# EasyEDA Pro project ProPrj_CSDR_2026-11-13.epro, schematic Schematic2

## Sheets
1 P1: Board Name: Board2; Create Date: 2026-11-10; Page Name: P1; Project Name: CSDR; Schematic Name: Schematic2; Update Date: 2026-11-10; Company: EasyEDA.com; Page Size: A4; Version: V1.0
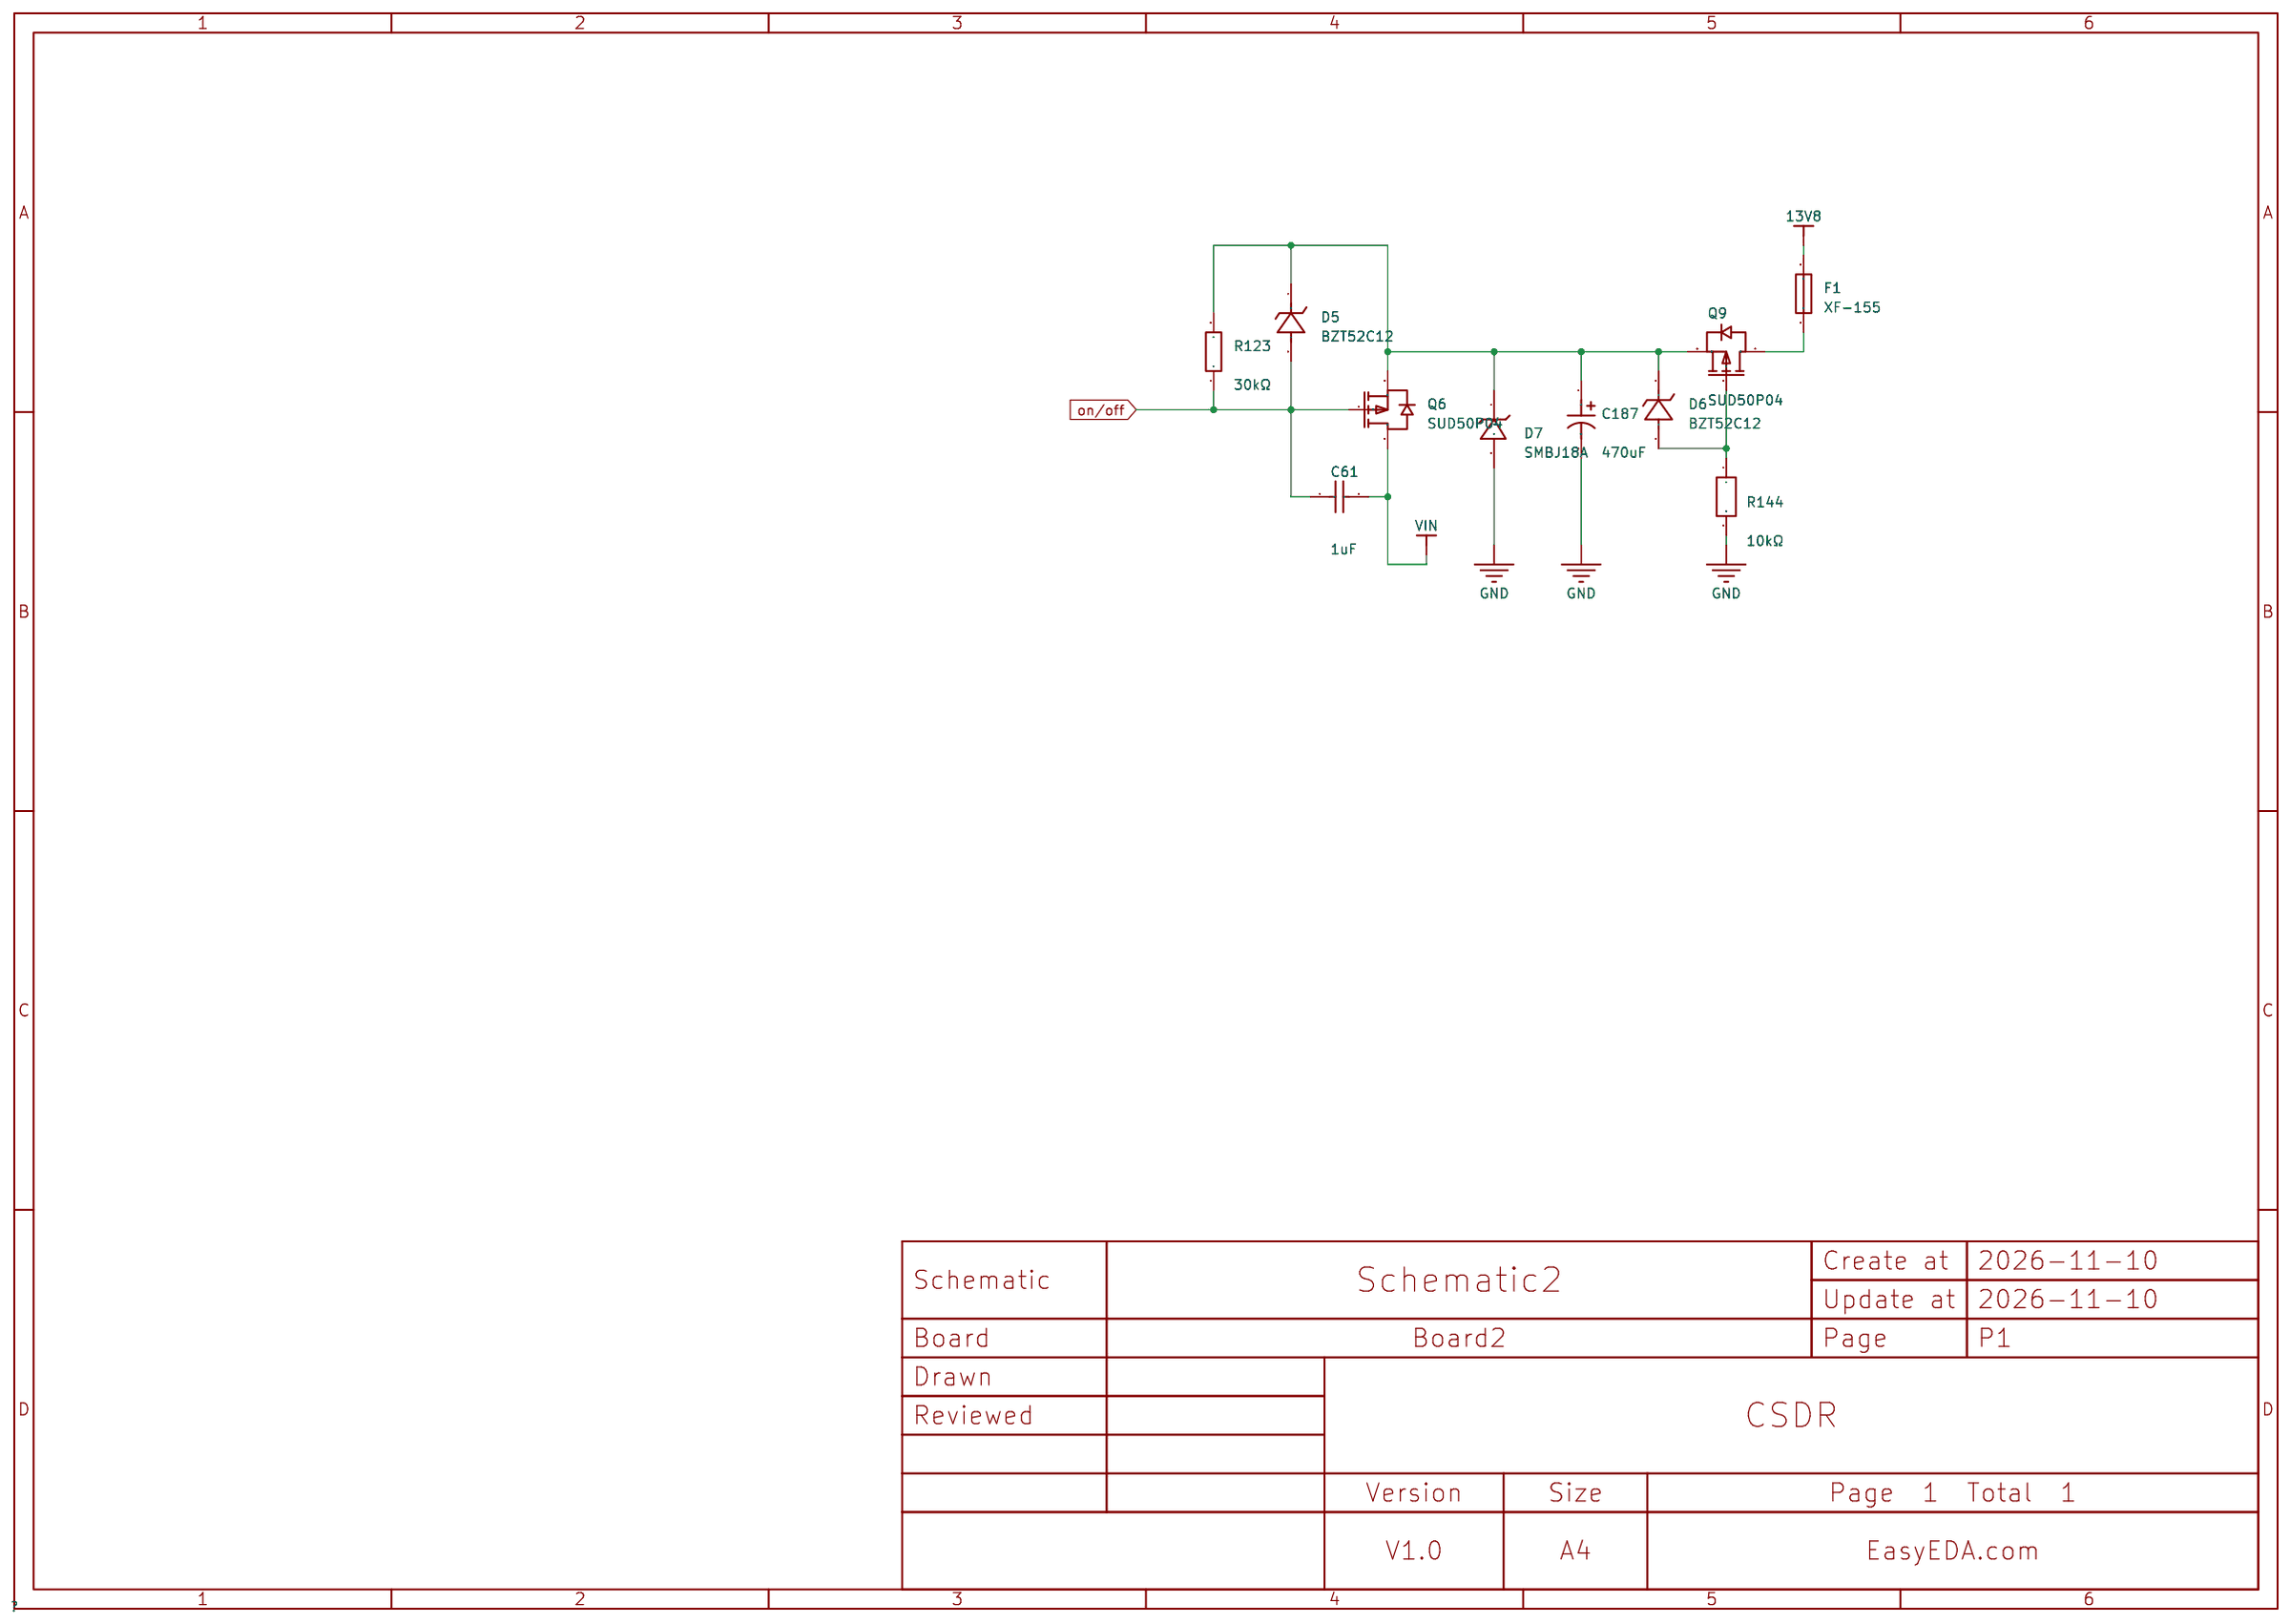
[diagram p0: P1]
2 PA_CONTROL: Board Name: Board1; Create Date: 2026-10-03; Schematic Name: Schematic1; Update Date: 2026-10-03
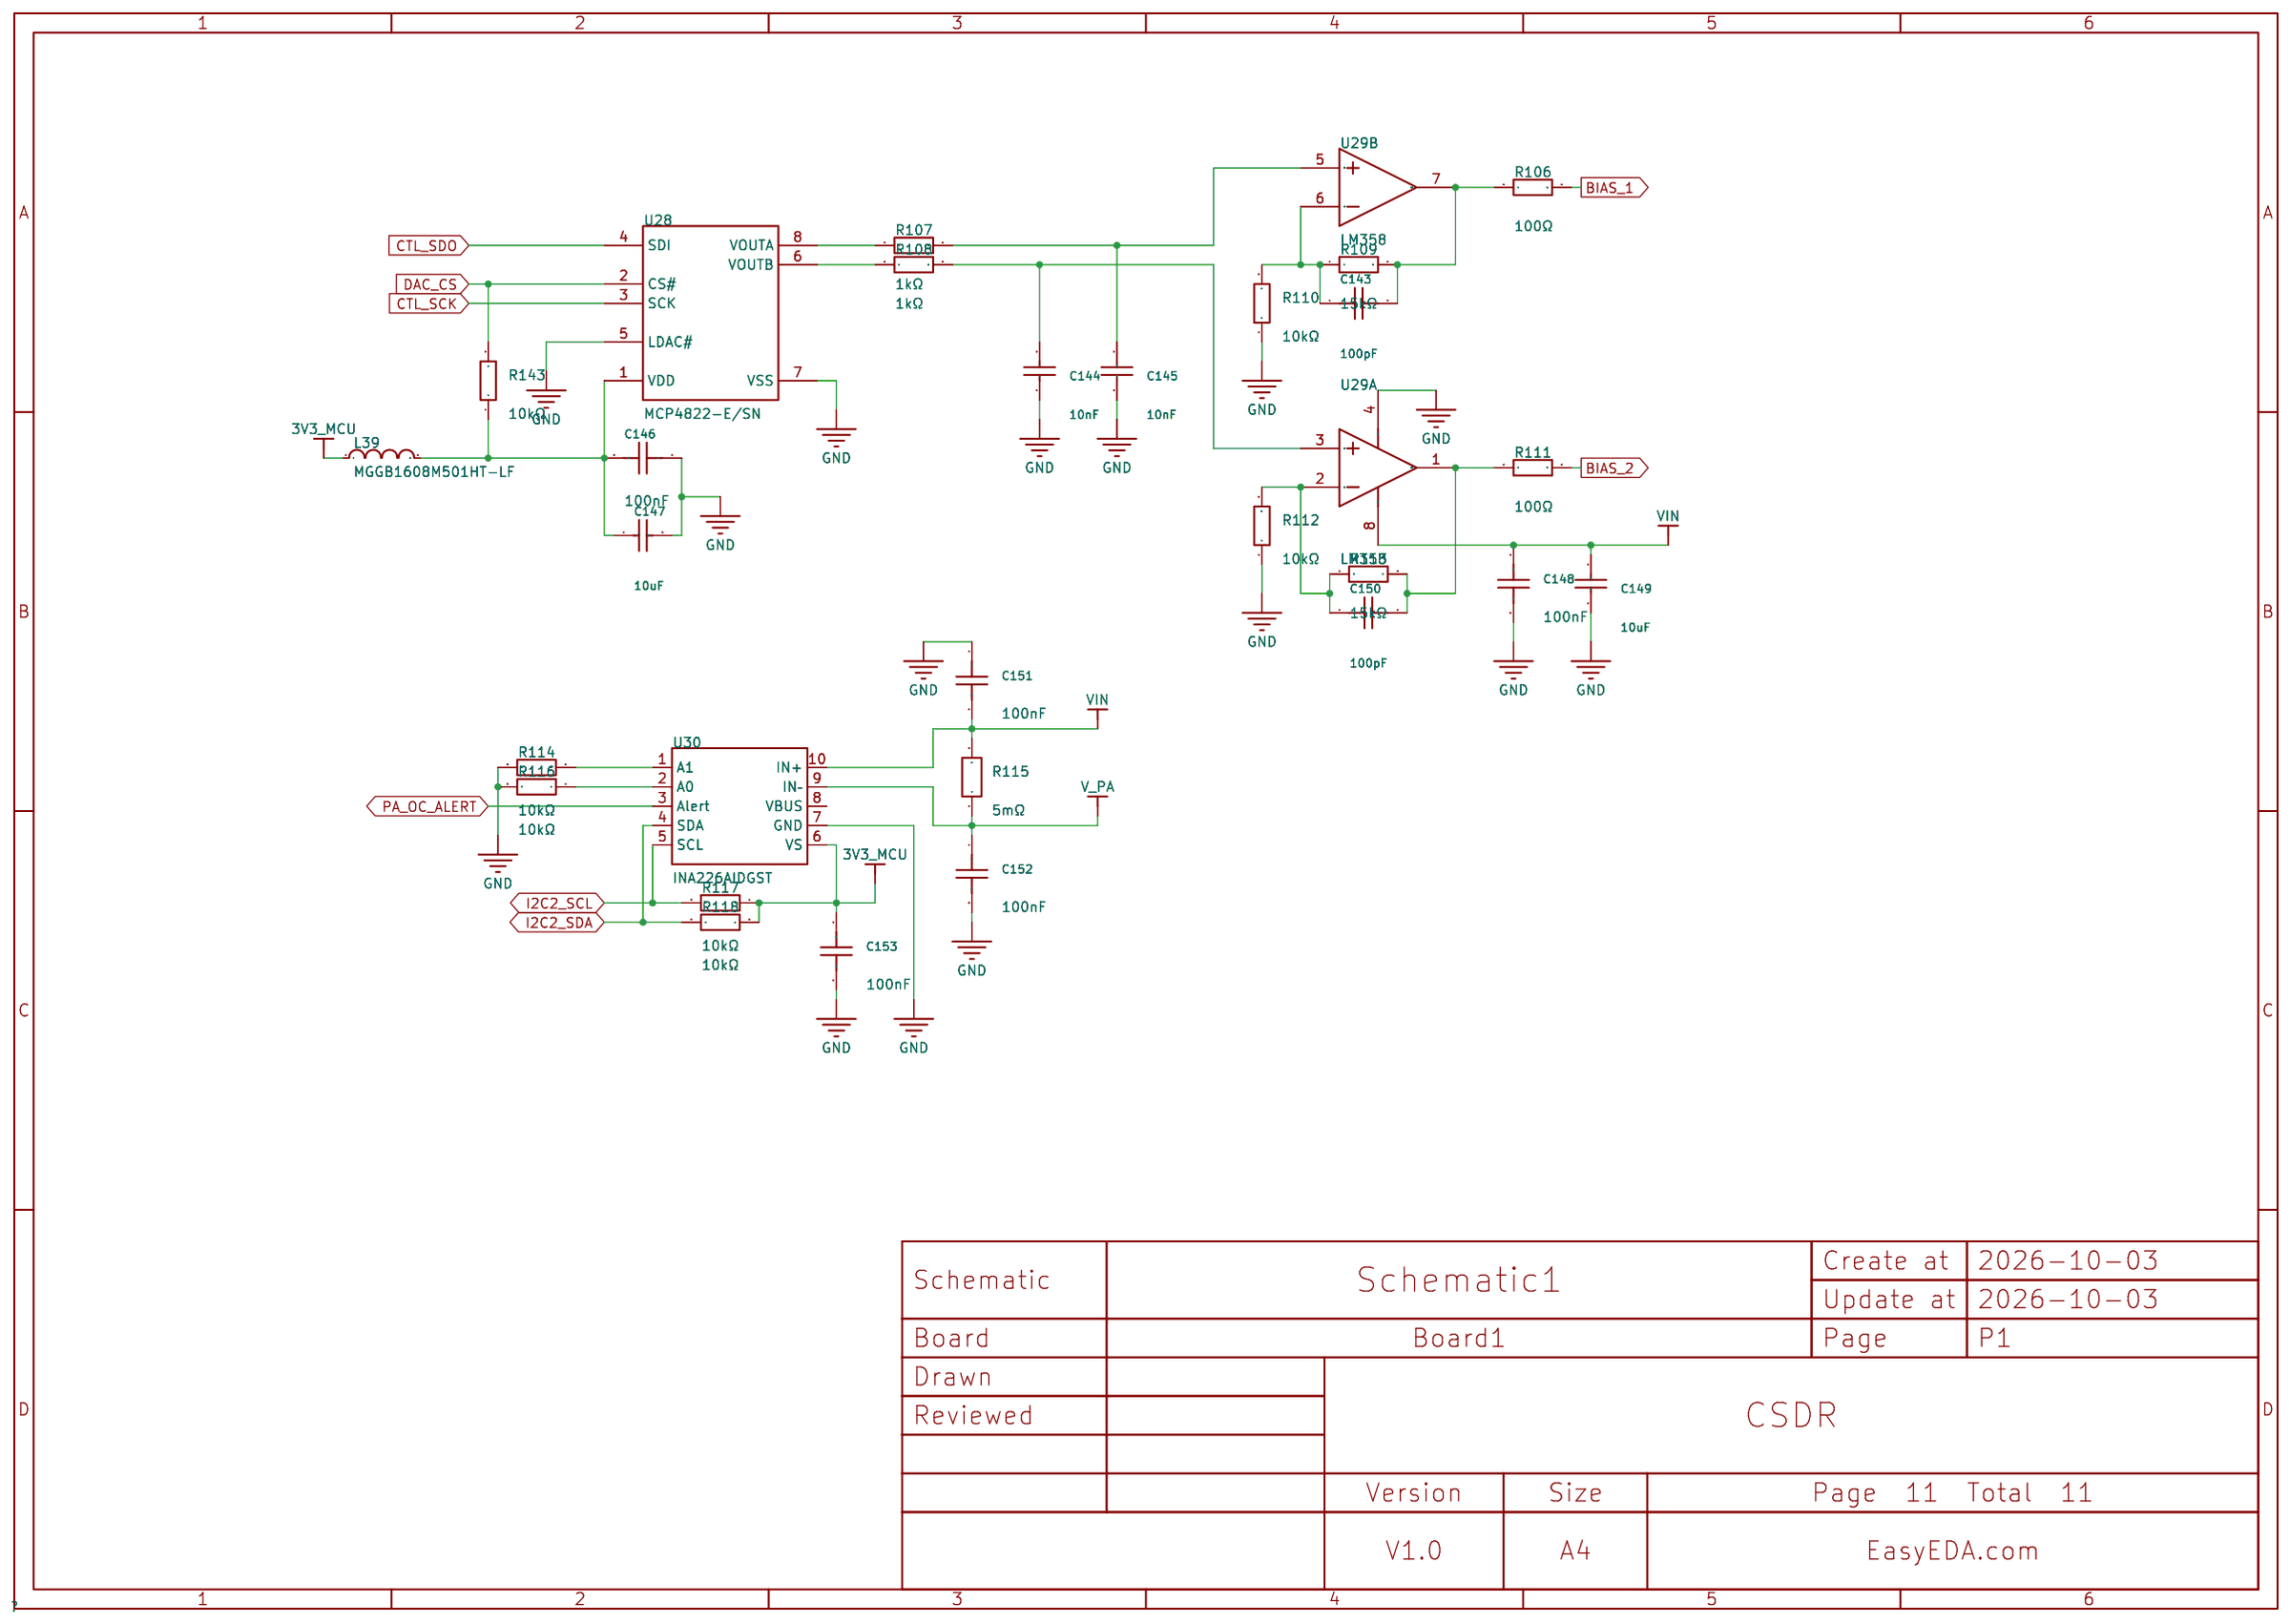
[diagram p1: PA_CONTROL]

## Parts
sheet P1
C61  1uF  [C0603]
C187  470uF  [CAP-SMD_BD6.3-L6.6-W6.6-LS7.3-FD-H7.7]
D5  BZT52C12  [SOD-123_L2.7-W1.7-LS3.8-RD]
D6  BZT52C12  [SOD-123_L2.7-W1.7-LS3.8-RD]
D7  SMBJ18A  [SMB_L4.6-W3.6-LS5.3-RD]
F1  XF-155  [FUSE-SMD_L10.5-W5.1]
Q6  SUD50P04  [TO-252-3_L6.6-W6.1-P4.57-LS9.9-BR-CW]
Q9  SUD50P04  [TO-252-3_L6.6-W6.1-P4.57-LS9.9-BR-CW]
R123  30kΩ  [R0603]
R144  10kΩ  [R0603]
sheet PA_CONTROL
C143  100pF  [C0603]
C144  10nF  [C0603]
C145  10nF  [C0603]
C146  100nF  [C0603]
C147  10uF  [C0603]
C148  100nF  [C0603]
C149  10uF  [C0603]
C150  100pF  [C0603]
C151  100nF  [C0603]
C152  100nF  [C0603]
C153  100nF  [C0603]
L39  MGGB1608M501HT-LF  [L0603]
R106  100Ω  [R0603]
R107  1kΩ  [R0603]
R108  1kΩ  [R0603]
R109  15kΩ  [R0603]
R110  10kΩ  [R0603]
R111  100Ω  [R0603]
R112  10kΩ  [R0603]
R113  15kΩ  [R0603]
R114  10kΩ  [R0603]
R115  5mΩ  [R2512]
R116  10kΩ  [R0603]
R117  10kΩ  [R0603]
R118  10kΩ  [R0603]
R143  10kΩ  [R0603]
U28  MCP4822-E/SN  [SOIC-8_L4.9-W3.9-P1.27-LS6.0-BL]
U29  LM358  [SOIC-8_L5.0-W4.0-P1.27-LS6.0-BL]  (sections 1,2)
U30  INA226AIDGST  [VSSOP-10_L3.0-W3.0-P0.50-LS4.9-BL]

## Library data of the parts
C61 = CL10A105KA8NNNC: Capacitance:1uF Tolerance:±10% Tolerance:±10% Voltage Rating:25V Temperature Coefficient:X5R; LCSC Part Name: 1uF ±10% 25V; Supplier Part: C5673; Manufacturer: SAMSUNG(三星); Supplier Footprint: 0603; JLCPCB Part Class: Extended Part; Datasheet: https://item.szlcsc.com/datasheet/CL10A105KA8NNNC/6132.html; Supplier: LCSC; Tolerance: ±10%; Voltage Rating: 25V; Temperature Coefficient: X5R
C187 = MA10V470M6X8: Capacitance:470uF Tolerance:±20% Tolerance:±20% Voltage Rating:10V Ripple Current:3.1A@100kHz Equivalent Series Resistance(ESR):20mΩ@100kHz Type:Polymer Diameter:6.3mm Height - Seated (Max):7mm Lifetime:2000hrs@105℃ Operating Temperature:-55℃~+105℃ Operat; LCSC Part Name: 470uF ±20% 10V; Supplier Part: C46550459; Manufacturer: JIERR(捷而瑞); Supplier Footprint: SMD,D6.3xL7.7mm; JLCPCB Part Class: Extended Part; Datasheet: https://item.szlcsc.com/datasheet/MA10V470M6X8/48680153.html; Supplier: LCSC; Tolerance: ±20%; Voltage Rating: 10V; Ripple Current: 3.1A@100kHz; Equivalent Series Resistance(ESR): 20mΩ@100kHz; Type: Polymer; Diameter: 6.3mm; Height - Seated (Max): 7mm; Lifetime: 2000hrs@105℃; Operating Temperature: -55℃~+105℃; Mounting Type: SMD; Polarity type: Polarized
D5 D6 = BZT52C12_C19078579: Diode Configuration:1 Independent Zener Voltage(Nom):12V Reverse Leakage Current (Ir):100nA@8V Zener Voltage(Range):11.4V~12.7V Zener Voltage(Range):11.4V~12.7V Pd - Power Dissipation:500mW Impedance(Zzt):25Ω Impedance(Zzk):150Ω Operating Junction Tempera; LCSC Part Name: 耐压:12V 电流:0.1uA@8.0V; Supplier Part: C19078579; Manufacturer: JUXING(钜兴); Supplier Footprint: SOD-123W; JLCPCB Part Class: Extended Part; Datasheet: https://item.szlcsc.com/datasheet/BZT52C12/20282827.html; Supplier: LCSC; Diode Configuration: 1 Independent; Zener Voltage(Nom): 12V; Reverse Leakage Current (Ir): 100nA@8V; Zener Voltage(Range): 11.4V~12.7V; Pd - Power Dissipation: 500mW; Impedance(Zzt): 25Ω; Impedance(Zzk): 150Ω; Operating Junction Temperature Range: -55℃~+150℃
D7 = SMBJ18A_C20883324: Polarity:Unidirectional Reverse Stand-Off Voltage (Vrwm):18V Clamping Voltage:29.2V Peak Pulse Current (Ipp):20.6A Peak Pulse Power Dissipation (Ppp):600W@10/1000us Voltage - Breakdown:22.1V Reverse Leakage Current (Ir):1uA Number of Channels:1 Operating; LCSC Part Name: 单向TVS 18V截止 峰值浪涌电流：20.6A; Supplier Part: C20883324; Manufacturer: OTW(联芯); Supplier Footprint: SMB(DO-214AA); JLCPCB Part Class: Extended Part; Datasheet: https://item.szlcsc.com/datasheet/SMBJ18A/22298784.html; Supplier: LCSC; Polarity: Unidirectional; Reverse Stand-Off Voltage (Vrwm): 18V; Clamping Voltage: 29.2V; Peak Pulse Current (Ipp): 20.6A; Peak Pulse Power Dissipation (Ppp): 600W@10/1000us; Voltage - Breakdown: 22.1V; Reverse Leakage Current (Ir): 1uA; Number of Channels: 1; Operating Temperature: -55℃~+150℃; Type: TVS
F1 = XF-155: Fuseholder Type:Bracket type Number of Circuits:1 Voltage Rating:500V Current Rating:15A Fuse Type:Rectangular prism Fuse Length:6.1mm Fuse Width:2.5mm; LCSC Part Name: 15A 500V 支座型; Supplier Part: C41371860; Manufacturer: XFCN(兴飞); Supplier Footprint: SMD; JLCPCB Part Class: Extended Part; Datasheet: https://item.szlcsc.com/datasheet/XF-155/43135981.html; Supplier: LCSC; Fuseholder Type: Bracket type; Number of Circuits: 1; Voltage Rating: 500V; Current Rating: 15A; Fuse Type: Rectangular prism; Fuse Length: 6.1mm; Fuse Width: 2.5mm
Q6 Q9 = SUD50P04: Number:1 P-Channel Drain to Source Voltage:40V Current - Continuous Drain(Id):50A RDS(on):7mΩ@10V Pd - Power Dissipation:52.1W Gate Threshold Voltage (Vgs(th)):1.2V Gate Charge(Qg):27.9nC Input Capacitance(Ciss):6.5nF Reverse Transfer Capacitance (Crss@Vd; LCSC Part Name: 耐压:40V 电流:50A; Supplier Part: C5370997; Manufacturer: TECH PUBLIC(台舟); Supplier Footprint: TO-252-3L; JLCPCB Part Class: Extended Part; Datasheet: https://item.szlcsc.com/datasheet/SUD50P04/6218034.html; Supplier: LCSC; Number: 1 P-Channel; Drain to Source Voltage: 40V; Current - Continuous Drain(Id): 50A; RDS(on): 7mΩ@10V; Pd - Power Dissipation: 52.1W; Gate Threshold Voltage (Vgs(th)): 1.2V; Gate Charge(Qg): 27.9nC; Input Capacitance(Ciss): 6.5nF; Reverse Transfer Capacitance (Crss@Vds): 605pF; Operating Temperature: -55℃~+150℃; Type: P-Channel; Output Capacitance(Coss): 790pF; Vgs: ±20V
R123 = RC0603FR-0730KL: Type:Thick Film Resistor Resistance:30kΩ Tolerance:±1% Tolerance:±1% Power(Watts):100mW Voltage-Supply(Max):75V Temperature Coefficient:±100ppm/℃ Temperature Coefficient:±100ppm/℃ Operating Temperature:-55℃~+155℃ Operating Temperature:-55℃~+155℃; LCSC Part Name: 厚膜电阻 30kΩ ±1% 100mW; Supplier Part: C100001; Manufacturer: YAGEO(国巨); Supplier Footprint: 0603; JLCPCB Part Class: Extended Part; Datasheet: https://item.szlcsc.com/datasheet/RC0603FR-0730KL/101215.html; Supplier: LCSC; Type: Thick Film Resistor; Tolerance: ±1%; Power(Watts): 100mW; Voltage-Supply(Max): 75V; Temperature Coefficient: ±100ppm/℃; Operating Temperature: -55℃~+155℃
R144 = CRG0603J10K: Type:Thick Film Resistor Resistance:10kΩ Tolerance:±5% Tolerance:±5% Power(Watts):100mW Voltage-Supply(Max):75V Temperature Coefficient:±200ppm/℃ Temperature Coefficient:±200ppm/℃ Operating Temperature:-55℃~+155℃ Operating Temperature:-55℃~+155℃; LCSC Part Name: 厚膜电阻 10kΩ ±5% 100mW; Supplier Part: C2073745; Manufacturer: TE Connectivity(泰科电子); Supplier Footprint: 0603; JLCPCB Part Class: Extended Part; Datasheet: https://item.szlcsc.com/datasheet/CRG0603J10K/2165331.html; Supplier: LCSC; Type: Thick Film Resistor; Tolerance: ±5%; Power(Watts): 100mW; Voltage-Supply(Max): 75V; Temperature Coefficient: ±200ppm/℃; Operating Temperature: -55℃~+155℃
C143 C150 = CC0603JRNPO9BN101: Capacitance:100pF Tolerance:±5% Tolerance:±5% Voltage Rating:50V Temperature Coefficient:NP0; LCSC Part Name: 100pF ±5% 50V; Supplier Part: C14665; Manufacturer: YAGEO(国巨); Supplier Footprint: 0603; JLCPCB Part Class: Extended Part; Datasheet: https://item.szlcsc.com/datasheet/CC0603JRNPO9BN101/15333.html; Supplier: LCSC; Tolerance: ±5%; Voltage Rating: 50V; Temperature Coefficient: NP0
C144 C145 = CC0603KRX7R9BB103: Capacitance:10nF Tolerance:±10% Tolerance:±10% Voltage Rating:50V Temperature Coefficient:X7R; LCSC Part Name: 10nF ±10% 50V; Supplier Part: C100042; Manufacturer: YAGEO(国巨); Supplier Footprint: 0603; JLCPCB Part Class: Extended Part; Datasheet: https://item.szlcsc.com/datasheet/CC0603KRX7R9BB103/101256.html; Supplier: LCSC; Tolerance: ±10%; Voltage Rating: 50V; Temperature Coefficient: X7R
C146 C148 C151-C153 = CC0603KRX7R9BB104: Capacitance:100nF Tolerance:±10% Tolerance:±10% Voltage Rating:50V Temperature Coefficient:X7R; LCSC Part Name: 100nF ±10% 50V; Supplier Part: C14663; Manufacturer: YAGEO(国巨); Supplier Footprint: 0603; JLCPCB Part Class: Basic Part; Datasheet: https://item.szlcsc.com/datasheet/CC0603KRX7R9BB104/15331.html; Supplier: LCSC; Tolerance: ±10%; Voltage Rating: 50V; Temperature Coefficient: X7R
C147 C149 = CL10A106MO8NQNC: Capacitance:10uF Tolerance:±20% Tolerance:±20% Voltage Rating:16V Temperature Coefficient:X5R; LCSC Part Name: 10uF ±20% 16V; Supplier Part: C92487; Manufacturer: SAMSUNG(三星); Supplier Footprint: 0603; JLCPCB Part Class: Extended Part; Datasheet: https://item.szlcsc.com/datasheet/CL10A106MO8NQNC/93680.html; Supplier: LCSC; Tolerance: ±20%; Voltage Rating: 16V; Temperature Coefficient: X5R
L39 = MGGB1608M501HT-LF: Impedance @ Frequency:500Ω@100MHz Tolerance:±25% Tolerance:±25% DC Resistance(DCR):- Current Rating:- Number of Circuits:1 Operating Temperature:- Operating Temperature:-; LCSC Part Name: 单路 0603磁珠 阻抗500Ω@100MHz; Supplier Part: C281149; Manufacturer: microgate(麦捷科技); Supplier Footprint: 0603; JLCPCB Part Class: Extended Part; Datasheet: https://item.szlcsc.com/datasheet/MGGB1608M501HT-LF/267482.html; Supplier: LCSC; Impedance @ Frequency: 500Ω@100MHz; Tolerance: ±25%; Number of Circuits: 1
R106 R111 = RC0603FR-07100RL: Type:Thick Film Resistor Resistance:100Ω Tolerance:±1% Tolerance:±1% Power(Watts):100mW Voltage-Supply(Max):75V Temperature Coefficient:±100ppm/℃ Temperature Coefficient:±100ppm/℃ Operating Temperature:-55℃~+155℃ Operating Temperature:-55℃~+155℃; LCSC Part Name: 厚膜电阻 100Ω ±1% 100mW; Supplier Part: C105588; Manufacturer: YAGEO(国巨); Supplier Footprint: 0603; JLCPCB Part Class: Extended Part; Datasheet: https://item.szlcsc.com/datasheet/RC0603FR-07100RL/106804.html; Supplier: LCSC; Type: Thick Film Resistor; Tolerance: ±1%; Power(Watts): 100mW; Voltage-Supply(Max): 75V; Temperature Coefficient: ±100ppm/℃; Operating Temperature: -55℃~+155℃
R107 R108 = RC0603FR-071KL: Type:Thick Film Resistor Resistance:1kΩ Tolerance:±1% Tolerance:±1% Power(Watts):100mW Voltage-Supply(Max):75V Temperature Coefficient:±100ppm/℃ Temperature Coefficient:±100ppm/℃ Operating Temperature:-55℃~+155℃ Operating Temperature:-55℃~+155℃; LCSC Part Name: 厚膜电阻 1kΩ ±1%; Supplier Part: C22548; Manufacturer: YAGEO(国巨); Supplier Footprint: 0603; JLCPCB Part Class: Extended Part; Datasheet: https://item.szlcsc.com/datasheet/RC0603FR-071KL/23274.html; Supplier: LCSC; Type: Thick Film Resistor; Tolerance: ±1%; Power(Watts): 100mW; Voltage-Supply(Max): 75V; Temperature Coefficient: ±100ppm/℃; Operating Temperature: -55℃~+155℃
R109 R113 = AC0603FR-0715KL: Type:Thick Film Resistor Resistance:15kΩ Tolerance:±1% Tolerance:±1% Power(Watts):100mW Voltage-Supply(Max):75V Temperature Coefficient:±100ppm/℃ Temperature Coefficient:±100ppm/℃ Operating Temperature:-55℃~+155℃ Operating Temperature:-55℃~+155℃; LCSC Part Name: 厚膜电阻 15kΩ ±1% 100mW; Supplier Part: C125928; Manufacturer: YAGEO(国巨); Supplier Footprint: 0603; JLCPCB Part Class: Extended Part; Datasheet: https://item.szlcsc.com/datasheet/AC0603FR-0715KL/137208.html; Supplier: LCSC; Type: Thick Film Resistor; Tolerance: ±1%; Power(Watts): 100mW; Voltage-Supply(Max): 75V; Temperature Coefficient: ±100ppm/℃; Operating Temperature: -55℃~+155℃
R110 R112 R114 R116-R118 R143 = RC0603JR-0710KL: Type:Thick Film Resistor Resistance:10kΩ Tolerance:±5% Tolerance:±5% Power(Watts):100mW Voltage-Supply(Max):75V Temperature Coefficient:±100ppm/℃ Temperature Coefficient:±100ppm/℃ Operating Temperature:-55℃~+155℃ Operating Temperature:-55℃~+155℃; LCSC Part Name: 厚膜电阻 10kΩ ±5% 100mW; Supplier Part: C99198; Manufacturer: YAGEO(国巨); Supplier Footprint: 0603; JLCPCB Part Class: Extended Part; Datasheet: https://item.szlcsc.com/datasheet/RC0603JR-0710KL/100411.html; Supplier: LCSC; Type: Thick Film Resistor; Tolerance: ±5%; Power(Watts): 100mW; Voltage-Supply(Max): 75V; Temperature Coefficient: ±100ppm/℃; Operating Temperature: -55℃~+155℃
R115 = PA2512FKF7T0R005E: Type:- Resistance:5mΩ Tolerance:±1% Tolerance:±1% Power(Watts):3W Temperature Coefficient:±100ppm/℃ Temperature Coefficient:±100ppm/℃ Operating Temperature:-55℃~+170℃ Operating Temperature:-55℃~+170℃; LCSC Part Name: 5mΩ ±1% 3W; Supplier Part: C728323; Manufacturer: YAGEO(国巨); Supplier Footprint: 2512; JLCPCB Part Class: Extended Part; Datasheet: https://item.szlcsc.com/datasheet/PA2512FKF7T0R005E/775638.html; Supplier: LCSC; Tolerance: ±1%; Power(Watts): 3W; Temperature Coefficient: ±100ppm/℃; Operating Temperature: -55℃~+170℃
U28 = MCP4822-E/SN: Resolution (Bits):12 Number of Channels:2 Interface:SPI Voltage - Supply:2.7V~5.5V Voltage - Supply:2.7V~5.5V Settling Time:4.5us Output Type:Voltage Buffer Integral non - linearity:12LSB Integral non - linearity:12LSB Operating Temperature:-40℃~+125℃ Ope; LCSC Part Name: 8/10/12位双电压输出数模转换器; Supplier Part: C16040; Manufacturer: MICROCHIP(美国微芯); Supplier Footprint: SOIC-8; JLCPCB Part Class: Extended Part; Datasheet: https://item.szlcsc.com/datasheet/MCP4822-E%252FSN/16722.html; Supplier: LCSC; Resolution (Bits): 12; Number of Channels: 2; Interface: SPI; Voltage - Supply: 2.7V~5.5V; Settling Time: 4.5us; Output Type: Voltage Buffer; Integral non - linearity: 12LSB; Operating Temperature: -40℃~+125℃; Function: Programmable gain；Integrated buffer；Power-down mode；Multi-chip synchronization；Power-on reset；Built-in reference source; Quiescent Current (Iq): 415uA
U29 = LM358_C53340896: Number of Channels:2 Rail to Rail:- Gain Bandwidth Product:1MHz Vos - Input Offset Voltage:2mV Input Offset Voltage Drift(Vos TC):- Slew Rate:400V/ms Ib - Input Bias Current:50nA Input Offset Current(Ios):10nA Input Voltage Noise Density:- Common Mode Rej; Supplier Part: C53340896; Manufacturer: TECH PUBLIC(台舟); Supplier Footprint: SOP-8; JLCPCB Part Class: Extended Part; Datasheet: https://item.szlcsc.com/datasheet/LM358/56444108.html; Supplier: LCSC; Number of Channels: 2; Gain Bandwidth Product: 1MHz; Vos - Input Offset Voltage: 2mV; Slew Rate: 400V/ms; Ib - Input Bias Current: 50nA; Input Offset Current(Ios): 10nA; Common Mode Rejection Ratio(CMRR): 80dB; Quiescent Current: 500uA; Output Current: 40mA; Operating Temperature: -20℃~+85℃; Single supply: 3V~24V; Dual Supply: -12V~-1.5V；1.5V~12V
U30 = INA226AIDGST: Number of Channels:- Vcm - Common Mode Voltage:36V Vcm - Common Mode Voltage:36V Gain:- Bandwidth:500kHz Ib - Input Bias Current:10uA Vos - Input Offset Voltage:2.5uV Operating Temperature:-40℃~+125℃ Operating Temperature:-40℃~+125℃ Differential Voltage:±; LCSC Part Name: 高侧/低侧双向电流/功率监视器; Supplier Part: C2653870; Manufacturer: TI(德州仪器); Supplier Footprint: VSSOP-10-0.5mm; JLCPCB Part Class: Extended Part; Datasheet: https://www.ti.com/cn/lit/ds/symlink/ina226.pdf; Supplier: LCSC; Vcm - Common Mode Voltage: 36V; Bandwidth: 500kHz; Ib - Input Bias Current: 10uA; Vos - Input Offset Voltage: 2.5uV; Operating Temperature: -40℃~+125℃; Differential Voltage: ±40V; Single Supply: 2.7V~5.5V; Quiescent Current: 330uA; Input Offset Voltage Drift(Vos TC): 0.1uV/℃; Common Mode Rejection Ratio (CMRR): 140dB; Features: Programmable threshold alarm；Digital output interface；High-side detection；Low-side detection；Power monitoring；Integrated ADC

## Nets
3V3_MCU: C153.1 L39.1 R117.1 R118.2 U30.6(VS)
13V8: F1.2
GND: C144.1 C145.1 C146.1 C147.2 C148.2 C149.2 C151.1 C152.2 C153.2 C187.2 D7.2(A) R110.1 R112.1 R114.2 R116.2 R144.2 U28.5(LDAC#) U28.7(VSS) U29.4(VEE) U30.7(GND)
VIN: C61.1 C148.1 C149.1 C151.2 Q6.2(D) R115.2 U29.8(VCC) U30.10(IN+)
BIAS_1: R106.2
BIAS_2: R111.2
CTL_SCK: U28.3(SCK)
CTL_SDO: U28.4(SDI)
DAC_CS: R143.2 U28.2(CS#)
I2C2_SCL: R117.2 U30.5(SCL)
I2C2_SDA: R118.1 U30.4(SDA)
on/off: C61.2 D5.2(A) Q6.1(G) R123.1
PA_OC_ALERT: U30.3(Alert)
V_PA: C152.1 R115.1 U30.9(IN–)
Net-(C143-1): C143.1 R109.1 R110.2 U29.6(IN2-)
Net-(C143-2): C143.2 R106.1 R109.2 U29.7(OUT2)
Net-(C144-2): C144.2 R108.2 U29.3(IN1+)
Net-(C145-2): C145.2 R107.2 U29.5(IN2+)
Net-(C146-2): C146.2 C147.1 L39.2 R143.1 U28.1(VDD)
Net-(C150-1): C150.1 R112.2 R113.1 U29.2(IN1-)
Net-(C150-2): C150.2 R111.1 R113.2 U29.1(OUT1)
Net-(C187-1): C187.1 D5.1(K) D6.1(K) D7.1(C) Q6.3(S) Q9.3(S) R123.2
Net-(D6-2): D6.2(A) Q9.1(G) R144.1
Net-(F1-1): F1.1 Q9.2(D)
Net-(R107-1): R107.1 U28.8(VOUTA)
Net-(R108-1): R108.1 U28.6(VOUTB)
Net-(R114-1): R114.1 U30.1(A1)
Net-(R116-1): R116.1 U30.2(A0)

Not connected (* = marked no-connect by the designer): U30 8(VBUS)
